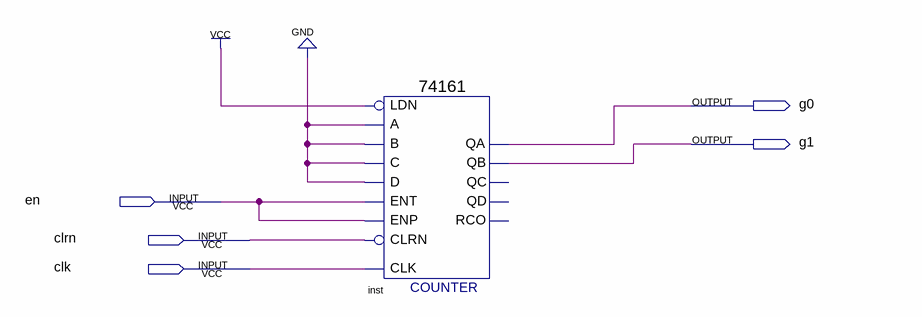
[diagram p0: schematic sheet]
// Quartus schematic gerador.bdf as structural Verilog: 1 symbols, 5 pins
module gerador (
  input  en,
  input  clrn,
  input  clk,
  output g0,
  output g1
);

  \74161  inst (
    .CLRN(clrn), .CLK(clk), .ENP(en), .LDN(1'b1), .A(1'b0), .D(1'b0), .ENT(en), .B(1'b0), .C(1'b0), .QB(g1),
    .QA(g0));  // open: QD, QC, RCO
endmodule
